# Altium schematic sheet Sheet5.SchDoc
size A; SheetNumber: 5; SheetTotal: 7
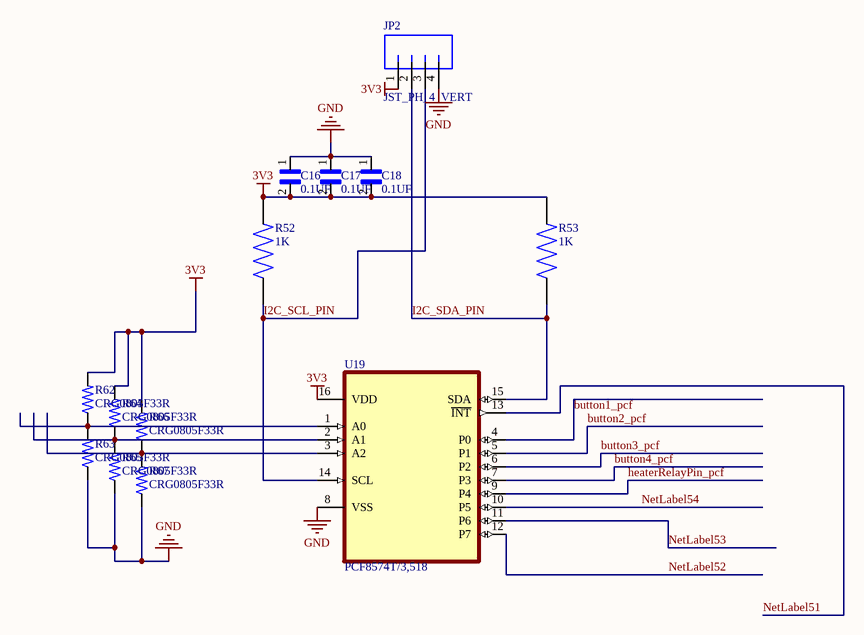
[diagram p0: Sheet5.SchDoc]

## Parts
C16  0.1UF  [CAPC2012X135N]
C17  0.1UF  [CAPC2012X135N]
C18  0.1UF  [CAPC2012X135N]
JP2  JST_PH_4_VERT  [JST-PH-4-PTH-VERT]
R52  1K  [RESC2012X65N]
R53  1K  [RESC2012X65N]
R62  CRG0805F33R  [RESC2012X65N]
R63  CRG0805F33R  [RESC2012X65N]
R64  CRG0805F33R  [RESC2012X65N]
R65  CRG0805F33R  [RESC2012X65N]
R66  CRG0805F33R  [RESC2012X65N]
R67  CRG0805F33R  [RESC2012X65N]
U19  PCF8574T/3,518  [SOIC127P1032X265-16N]

## Nets
3V3: C16.2 C17.2 C18.2 JP2.1 R52.2 R53.2 R62.2 R64.2 R66.2 U19.16(VDD)
GND: C16.1 C17.1 C18.1 JP2.4 R63.1 R65.1 R67.1 U19.8(VSS)
button1_pcf: U19.4(P0)
button2_pcf: U19.5(P1)
button3_pcf: U19.6(P2)
button4_pcf: U19.7(P3)
heaterRelayPin_pcf: U19.9(P4)
I2C_SCL_PIN: JP2.3 R52.1 U19.14(SCL)
I2C_SDA_PIN: JP2.2 R53.1 U19.15(SDA)
NetLabel51: U19.13(~{INT})
NetLabel52: U19.12(P7)
NetLabel53: U19.11(P6)
NetLabel54: U19.10(P5)
NetR62_1: R62.1 R63.2 U19.1(A0)
NetR64_1: R64.1 R65.2 U19.2(A1)
NetR66_1: R66.1 R67.2 U19.3(A2)

## Library data of the parts
C16-C18 = GCM2165C2A151JA16D: Cap Ceramic 150pF 100V C0G 5% Pad SMD 0805 125Â°C Automotive T/R; Package: None; Price: None; Value: *; MP: GCM2165C2A151JA16D; Availability: Unavailable
JP2 = JST_PH_4_VERT: PartNumber: B4B-PH-K-S(LF)(SN); Manufacturer: JST Sales America Inc.; PackageReference: JST-PH; Mounting Technology: Through Hole
R52 R53 = RN73C2A3K3BTDF: TE; IND Devices; Resistors; RN 0805 3K3 0.1% 10PPM 1K RL | TE Connectivity RN73C2A3K3BTDF; Power_Rating: .1 W; Resistance: 3.3K; Voltage_Rating: 100 V; Tolerance: .1%; SnapEDA_Link: https://www.snapeda.com/parts/RN73C2A3K3BTDF/TE+Connectivity/view-part/?ref=snap; Package: 0805; Value: *; MF: TE Connectivity; MP: RN73C2A3K3BTDF; EU_RoHS_Compliance: Compliant; Check_prices: https://www.snapeda.com/parts/RN73C2A3K3BTDF/TE+Connectivity/view-part/?ref=eda
R62-R67 = CRG0805F33R: Fixed Resistors; MF: TE Connectivity; Price: None; MP: CRG0805F33R; Package: 0805; Value: *; Purchase-URL: https://pricing.snapeda.com/search/part/CRG0805F33R/?ref=eda; Check_prices: https://www.snapeda.com/parts/CRG0805F33R/TE+Connectivity+Passive+Product/view-part/?ref=eda; Availability: In Stock; EU_RoHS_Compliance: Compliant with Exemptions; SnapEDA_Link: https://www.snapeda.com/parts/CRG0805F33R/TE+Connectivity+Passive+Product/view-part/?ref=snap
U19 = PCF8574T/3,518: I/O Expander 8 IÂ²C 100 kHz 16-SO; MF: NXP USA; Package: SOIC-16 NXP Semiconductors; Check_prices: https://www.snapeda.com/parts/PCF8574T/3,518/NXP+USA+Inc./view-part/?ref=eda; Value: *; Purchase-URL: https://pricing.snapeda.com/search/part/PCF8574T/3,518/?ref=eda; Availability: In Stock; SnapEDA_Link: https://www.snapeda.com/parts/PCF8574T/3,518/NXP+USA+Inc./view-part/?ref=snap; MP: PCF8574T/3,518; Price: None